# Altium project Powermodule-v7.0.3.PrjPcb (part 1 of 2)
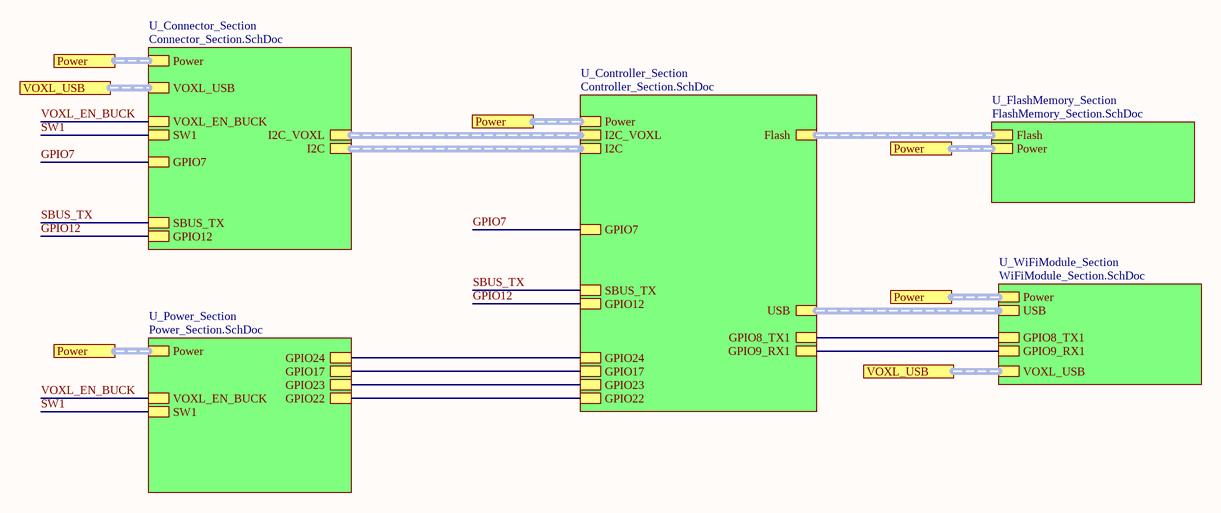
[diagram p0: Top-Sheet.SchDoc]
6 sheets, 138 parts. Net scope: hierarchical (ports join the sheet entries above them; power ports are global).
Board file: PCB-Powermodule-v7.0.3.PcbDoc
Sheets:
  Top-Sheet.SchDoc
    U_Connector_Section = Connector_Section.SchDoc
    U_Controller_Section = Controller_Section.SchDoc
    U_FlashMemory_Section = FlashMemory_Section.SchDoc
    U_Power_Section = Power_Section.SchDoc
    U_WiFiModule_Section = WiFiModule_Section.SchDoc

## Sheet Top-Sheet.SchDoc
size A4; SheetNumber: 1; SheetTotal: 6

### Sub-sheets
U_Connector_Section = Connector_Section.SchDoc: Power (harness Power), I2C_VOXL (harness I2C_VOXL), I2C (harness I2C), VOXL_USB (harness VOXL_USB), SW1, VOXL_EN_BUCK, GPIO7, SBUS_TX, GPIO12
U_Controller_Section = Controller_Section.SchDoc: Flash (harness Flash), Power (harness Power), I2C_VOXL (harness I2C_VOXL), I2C (harness I2C), USB (harness USB), GPIO7, SBUS_TX, GPIO12, GPIO8_TX1, GPIO9_RX1, GPIO24, GPIO17, GPIO23, GPIO22
U_FlashMemory_Section = FlashMemory_Section.SchDoc: Flash (harness Flash), Power (harness Power)
U_Power_Section = Power_Section.SchDoc: Power (harness Power), SW1, VOXL_EN_BUCK, GPIO24, GPIO17, GPIO23, GPIO22
U_WiFiModule_Section = WiFiModule_Section.SchDoc: VOXL_USB (harness VOXL_USB), USB (harness USB), GPIO8_TX1, GPIO9_RX1, Power (harness Power)

### Ports
Power, VOXL_USB

### Nets
VOXL_EN_BUCK: sheet U_Connector_Section/VOXL_EN_BUCK, sheet U_Power_Section/VOXL_EN_BUCK
GPIO7: sheet U_Connector_Section/GPIO7, sheet U_Controller_Section/GPIO7
GPIO8_TX1: sheet U_Controller_Section/GPIO8_TX1, sheet U_WiFiModule_Section/GPIO8_TX1
GPIO9_RX1: sheet U_Controller_Section/GPIO9_RX1, sheet U_WiFiModule_Section/GPIO9_RX1
GPIO12: sheet U_Connector_Section/GPIO12, sheet U_Controller_Section/GPIO12
GPIO17: sheet U_Controller_Section/GPIO17, sheet U_Power_Section/GPIO17
GPIO22: sheet U_Controller_Section/GPIO22, sheet U_Power_Section/GPIO22
GPIO23: sheet U_Controller_Section/GPIO23, sheet U_Power_Section/GPIO23
GPIO24: sheet U_Controller_Section/GPIO24, sheet U_Power_Section/GPIO24
SBUS_TX: sheet U_Connector_Section/SBUS_TX, sheet U_Controller_Section/SBUS_TX
SW1: sheet U_Connector_Section/SW1, sheet U_Power_Section/SW1

### Buses and harness runs
harness port Power = sheet U_Connector_Section/Power
harness port Power = sheet U_Controller_Section/Power
harness port Power = sheet U_FlashMemory_Section/Power
harness port Power = sheet U_Power_Section/Power
harness port Power = sheet U_WiFiModule_Section/Power
harness port VOXL_USB = sheet U_Connector_Section/VOXL_USB
harness port VOXL_USB = sheet U_WiFiModule_Section/VOXL_USB
harness sheet U_Connector_Section/I2C = sheet U_Controller_Section/I2C
harness sheet U_Connector_Section/I2C_VOXL = sheet U_Controller_Section/I2C_VOXL
harness sheet U_Controller_Section/Flash = sheet U_FlashMemory_Section/Flash
harness sheet U_Controller_Section/USB = sheet U_WiFiModule_Section/USB

### Notes on the sheet
- File:
- Title:
- Date:
- Page
- Num:
- Total:
- Drawn By: Huzaifa Ali

## Sheet Connector_Section.SchDoc
size 420 x 297 mm; SheetNumber: 6; SheetTotal: 6
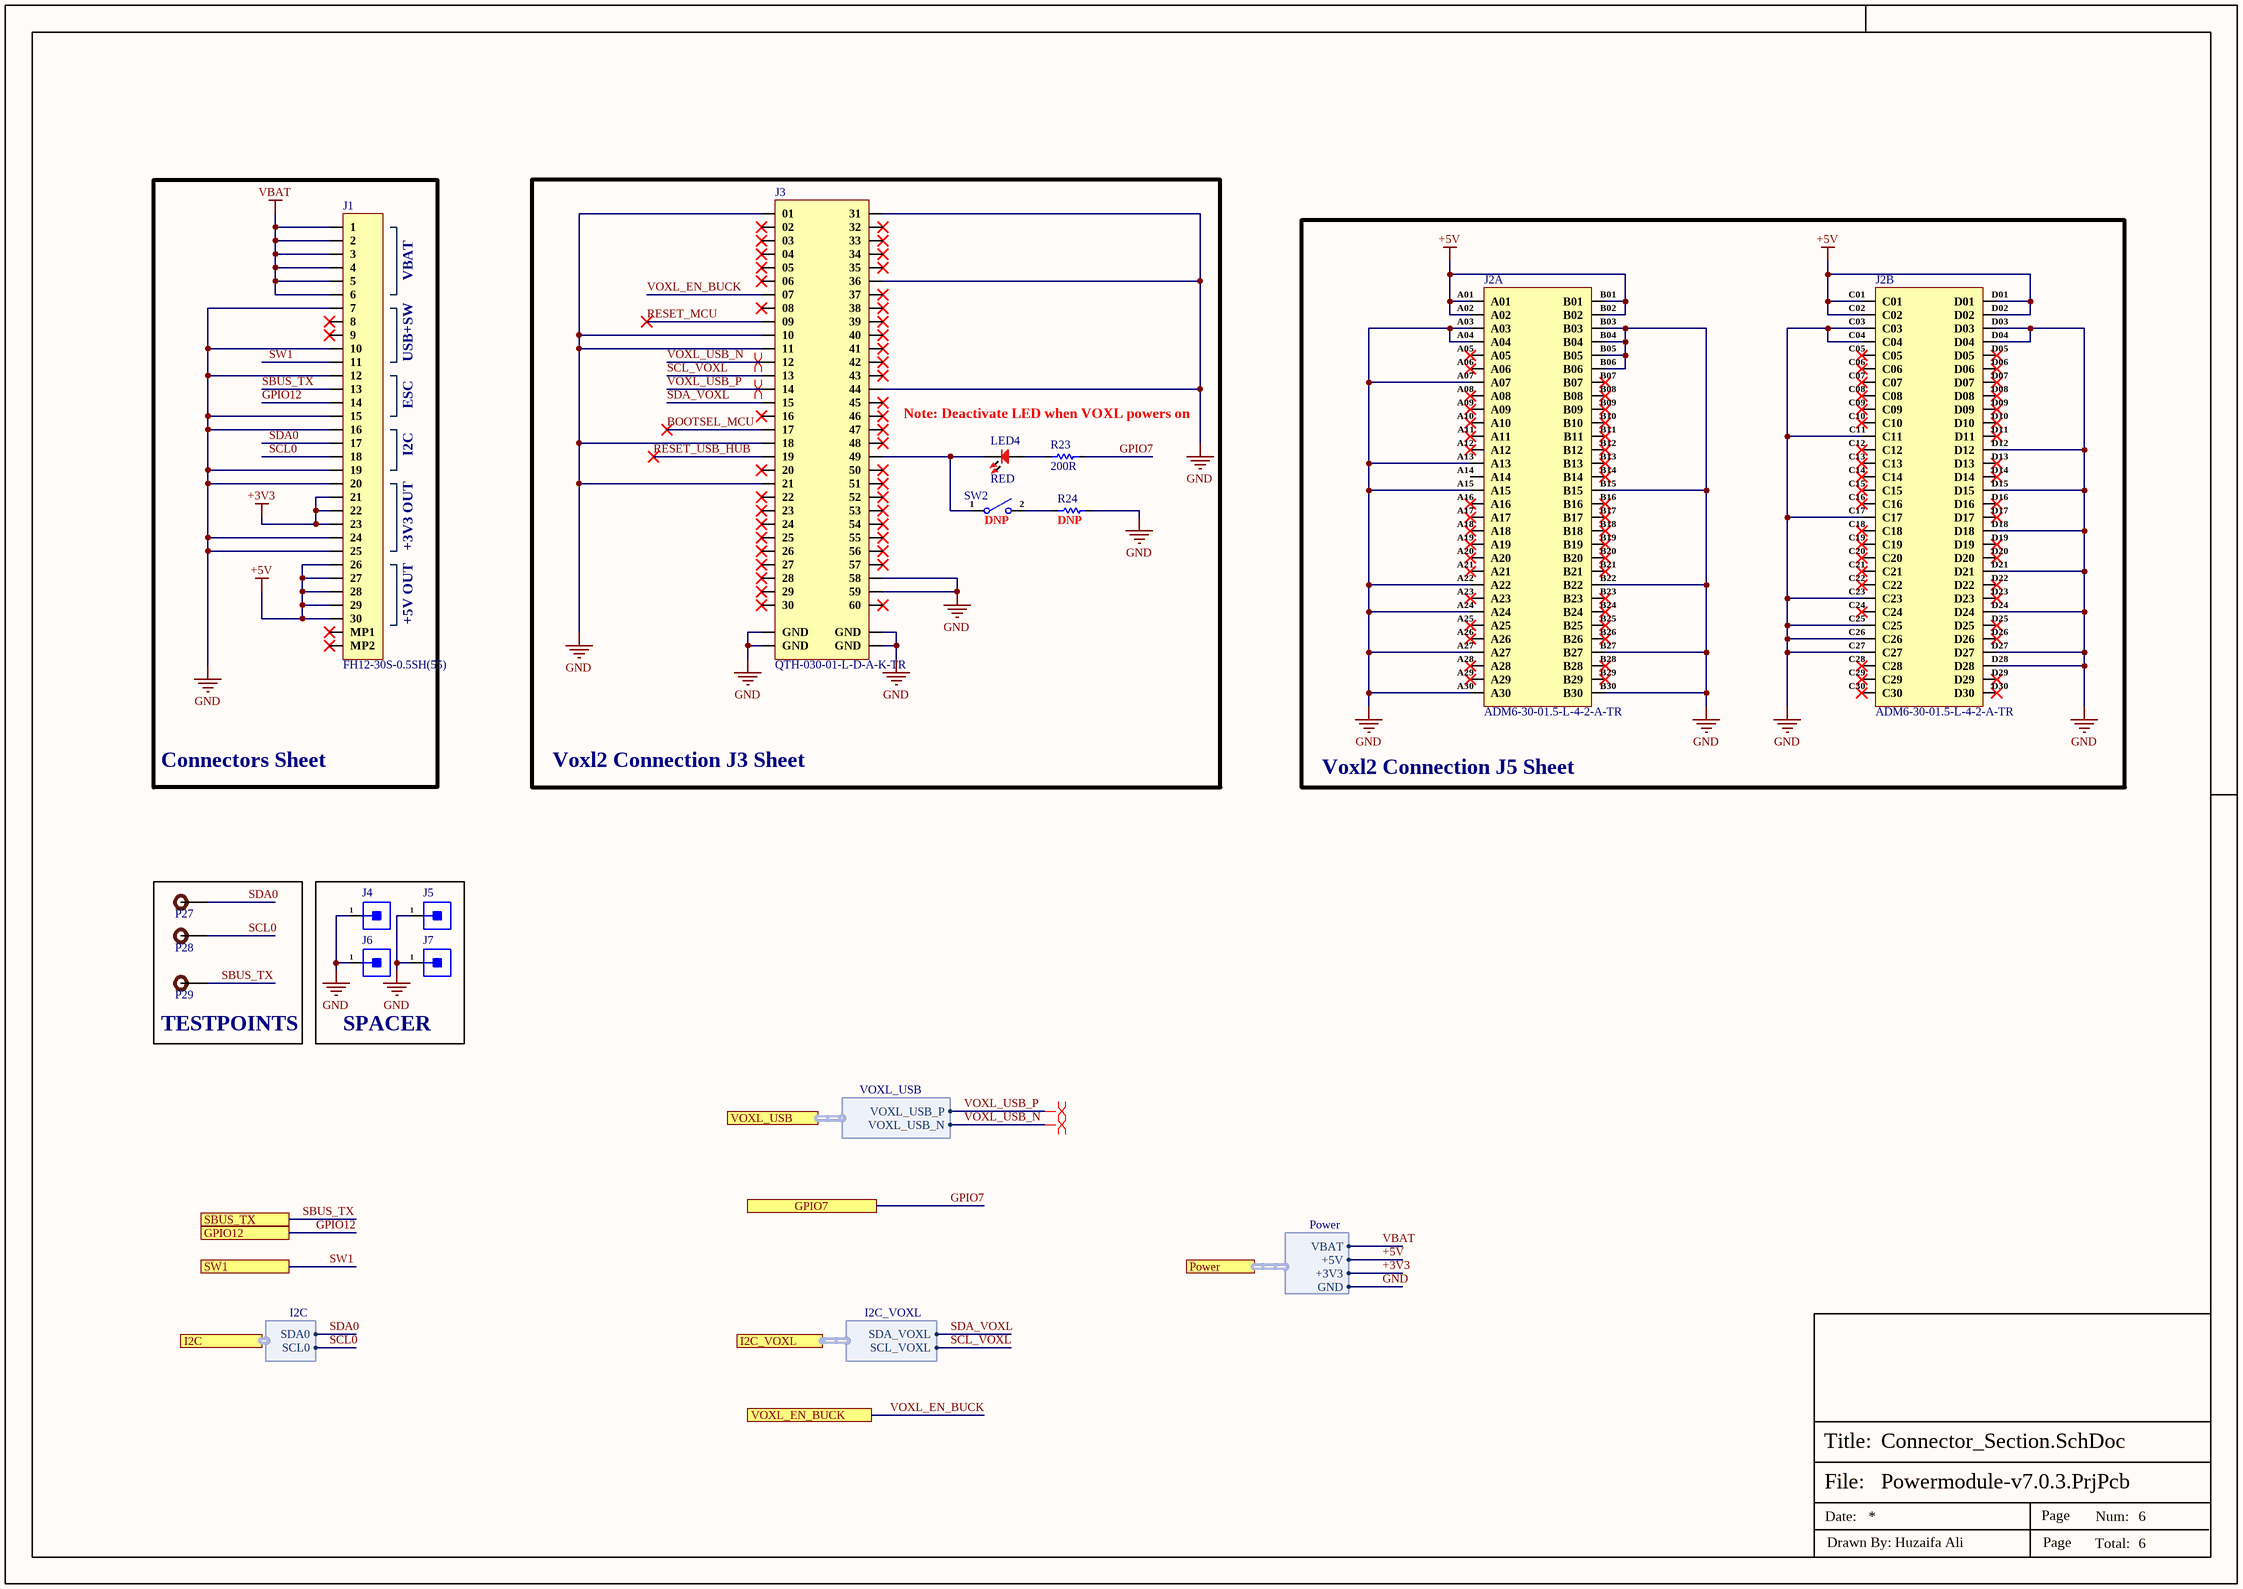
[diagram p1: Connector_Section.SchDoc]

### Parts
J1  FH12-30S-0.5SH(55)  [FH12-30S-0.5SH(55)]
J2  ADM6-30-01.5-L-4-2-A-TR  [ADM6-30-01.5-L-4-2-A-TR]  (parts A,B of 2)
J3  QTH-030-01-L-D-A-K-TR  [QTH-030-01-L-D-A-K-TR]
J4  9774050151R  [Spacer]  (value not drawn)
J5  9774050151R  [Spacer]  (value not drawn)
J6  9774050151R  [Spacer]  (value not drawn)
J7  9774050151R  [Spacer]  (value not drawn)
LED4  RED  [LED-0603]
P27  TEST POINT  [Test-point]  (value not drawn)
P28  TEST POINT  [Test-point]  (value not drawn)
P29  TEST POINT  [Test-point]  (value not drawn)
R23  200R  [Res-0603]
R24  DNP  [Res-0603]
SW2  DNP  [EVQ-P7J01P]

### Blocks framed on the sheet
Connectors Sheet: J1
Voxl2 Connection J3 Sheet: J3 LED4 R23 R24 SW2
Voxl2 Connection J5 Sheet: J2
TESTPOINTS: P27-P29
SPACER: J4-J7

### Ports
GPIO7 (see Top-Sheet[1B], Controller_Section[1D]), GPIO12 (see Top-Sheet[1B], Controller_Section[1D]), I2C (harness I2C, see Top-Sheet[2B], Controller_Section[3D]), I2C_VOXL (harness I2C_VOXL, see Top-Sheet[2B], Controller_Section[2D]), Power (harness Power, see Top-Sheet[1B], Controller_Section[2D], FlashMemory_Section[1D], Power_Section[3D], WiFiModule_Section[2D]), SBUS_TX (see Top-Sheet[1B], Controller_Section[1D]), SW1 (see Top-Sheet[1B], Power_Section[2D]), VOXL_EN_BUCK (see Top-Sheet[1B], Power_Section[2D]), VOXL_USB (harness VOXL_USB, see Top-Sheet[1B], WiFiModule_Section[2D])

### Harnesses
Power: +5V, +3V3, GND, VBAT
I2C_VOXL: SCL_VOXL, SDA_VOXL
I2C: SDA0, SCL0
VOXL_USB: VOXL_USB_P, VOXL_USB_N

### Nets
+3V3: J1.21 J1.22 J1.23 ; port Power.+3V3
+5V: J1.26 J1.27 J1.28 J1.29 J1.30 J2.A01 J2.A02 J2.B01 J2.B02 J2.C01 J2.C02 J2.D01 J2.D02 ; port Power.+5V
GND: J1.7 J1.10 J1.12 J1.15 J1.16 J1.19 J1.20 J1.24 J1.25 J2.A03 J2.A04 J2.A07 J2.A13 J2.A15 J2.A22 J2.A24 J2.A27 J2.A30 J2.B03 J2.B04 J2.B05 J2.B06 J2.B15 J2.B22 J2.B27 J2.B30 J2.C03 J2.C04 J2.C11 J2.C17 J2.C23 J2.C25 J2.C26 J2.C27 J2.D03 J2.D04 J2.D12 J2.D15 J2.D18 J2.D21 J2.D24 J2.D27 J2.D28 J3.01 J3.10 J3.11 J3.18 J3.21 J3.31 J3.36 J3.44 J3.58 J3.59 J3.G1(GND) J3.G2(GND) J3.G3(GND) J3.G4(GND) J4.1 J5.1 J6.1 J7.1 R24.2 ; port Power.GND
VBAT: J1.1 J1.2 J1.3 J1.4 J1.5 J1.6 ; port Power.VBAT
VOXL_EN_BUCK: J3.07 ; port VOXL_EN_BUCK
BOOTSEL_MCU: J3.17
GPIO7: R23.2 ; port GPIO7
GPIO12: J1.14 ; port GPIO12
RESET_MCU: J3.09
RESET_USB_HUB: J3.19
SBUS_TX: J1.13 P29.1 ; port SBUS_TX
SCL0: J1.18 P28.1 ; port I2C.SCL0
SCL_VOXL: J3.13 ; port I2C_VOXL.SCL_VOXL
SDA0: J1.17 P27.1 ; port I2C.SDA0
SDA_VOXL: J3.15 ; port I2C_VOXL.SDA_VOXL
SW1: J1.11 ; port SW1
VOXL_USB_N: J3.12 ; port VOXL_USB.VOXL_USB_N
VOXL_USB_P: J3.14 ; port VOXL_USB.VOXL_USB_P
NetJ3_49: J3.49 LED4.2 SW2.1
NetLED4_1: LED4.1 R23.1
NetR24_1: R24.1 SW2.2

Not connected (* = marked no-connect by the designer): J1 8* 9* MP1* MP2*; J2 A05* A06* A08* A09* A10* A11* A12* A14 A16* A17* A18* A19* A20* A21* A23* A25* A26* A28* A29* B07* B08* B09* B10* B11* B12* B13* B14* B16* B17* B18* B19* B20* B21* B23* B24* B25* B26* B28* B29* C05* C06* C07* C08* C09* C10* C12* C13* C14* C15* C16* C18* C19* C20* C21* C22* C24* C28* C29* C30* D05* D06* D07* D08* D09* D10* D11* D13* D14* D16* D17* D19* D20* D22* D23* D25* D26* D29* D30*; J3 02* 03* 04* 05* 06* 08* 16* 20* 22* 23* 24* 25* 26* 27* 28* 29* 30* 32* 33* 34* 35* 37* 38* 39* 40* 41* 42* 43* 45* 46* 47* 48* 50* 51* 52* 53* 54* 55* 56* 57* 60*

### Layout directives
differential pair; net class VOXL_USB; differential pair class VOXL_USB_Lines; rule Matched Net Lengths [Tolerance = 0.508mm]; rule Impedance Constraint [Min = 88.00    Max = 102.0    ]: VOXL_USB_N, VOXL_USB_P

### Notes on the sheet
- VBAT
- USB+SW
- ESC
- I2C
- Note: Deactivate LED when VOXL powers on
- +3V3 OUT
- +5V OUT
- File:
- Title:
- Date:
- Page
- Num:
- Total:
- Drawn By: Huzaifa Ali

### Library data of the parts
J1 = FH12-30S-0.5SH(55): CONN FFC BOTTOM 30POS 0.5MM R/A; Manufacturer: Hirose; Connector Type: 4640ConnectorType; Contact Voltage Rating (AC): 50V; Contact Pitch: 500um; Item Type: FFC/FPC Connector; Supplier: Future Electronics; Supplier Part Number: 6825061; Manufacturer Part Number: FH12-30S-0.5SH(55); RoHS: Yes; Category: FFC / FPC; Stock: 2000; Pricing: 2000=1.38 (USD); ComponentLink1URL: https://datasheet.ciiva.com/11745/0900766b80d985fc-11745247.pdf?src-supplier=Rs; ComponentLink1Description: https://datasheet.ciiva.com/11745/0900766b80d985fc-11745247.pdf?src-supplier=Rs; ComponentLink2URL: https://datasheet.ciiva.com/15176/getdatasheetpartid-439676-15176854.pdf?src-supplier=Verical; ComponentLink2Description: https://datasheet.ciiva.com/15176/getdatasheetpartid-439676-15176854.pdf?src-supplier=Verical; ComponentLink3URL: https://datasheet.ciiva.com/22630/58803-22630360.pdf?src-supplier=Farnell; ComponentLink3Description: https://datasheet.ciiva.com/22630/58803-22630360.pdf?src-supplier=Farnell; ComponentLink4URL: https://datasheet.ciiva.com/7661/58803-7661387.pdf?src-supplier=Element14; ComponentLink4Description: https://datasheet.ciiva.com/7661/58803-7661387.pdf?src-supplier=Element14; LCSC Part Number: C506793
J2 = ADM6-30-01.5-L-4-2-A-TR: CONN 0.635MM HDR 30POS SMD; Manufacturer: Samtec; Item Type: Connector; Supplier: Rs; Supplier Part Number: 2502799; Manufacturer Part Number: ADM6-30-01.5-L-4-2-A-TR; RoHS: No; Category: Connectors; Stock: 10; Pricing: 1=20.84 (GBP); ComponentLink1URL: http://suddendocs.samtec.com/catalog_english/adm6.pdf?src-supplier=Digi-Key; ComponentLink1Description: http://suddendocs.samtec.com/catalog_english/adm6.pdf?src-supplier=Digi-Key; ComponentLink2URL: https://datasheet.octopart.com/ADM6-30-01.5-L-4-2-A-TR-Samtec-datasheet-156965346.pdf?src-supplier=Sager+Electronics; ComponentLink2Description: https://datasheet.octopart.com/ADM6-30-01.5-L-4-2-A-TR-Samtec-datasheet-156965346.pdf?src-supplier=Sager+Electronics; ComponentLink3URL: https://datasheet.octopart.com/ADM6-30-01.5-L-4-2-A-TR-Samtec-datasheet-154586211.pdf?src-supplier=Toby+Electronics; ComponentLink3Description: https://datasheet.octopart.com/ADM6-30-01.5-L-4-2-A-TR-Samtec-datasheet-154586211.pdf?src-supplier=Toby+Electronics; ComponentLink4URL: https://datasheet.octopart.com/ADM6-30-01.5-L-4-2-A-TR-Samtec-datasheet-142027009.pdf?src-supplier=Master+Electronics; ComponentLink4Description: https://datasheet.octopart.com/ADM6-30-01.5-L-4-2-A-TR-Samtec-datasheet-142027009.pdf?src-supplier=Master+Electronics
J3 = QTH-030-01-L-D-A-K-TR: CONN HDR 60POS SMD GOLD; Manufacturer: Samtec; Supplier: Rs; Supplier Part Number: 1802786; Manufacturer Part Number: QTH-030-01-L-D-A-K-TR; RoHS: Yes; Category: Connectors; Stock: 69; Pricing: 1=9.4, 25=8.99, 100=7.57, 250=6.25, 500=6.09 (GBP); ComponentLink1URL: https://datasheet.ciiva.com/9698/qth-9698170.pdf?src-supplier=Avnet; ComponentLink1Description: https://datasheet.ciiva.com/9698/qth-9698170.pdf?src-supplier=Avnet; ComponentLink2URL: https://datasheet.ciiva.com/400/qth-xxx-xx-x-d-xxx-mkt-400842.pdf?src-supplier=Digikey; ComponentLink2Description: https://datasheet.ciiva.com/400/qth-xxx-xx-x-d-xxx-mkt-400842.pdf?src-supplier=Digikey
J4-J7 = 9774050151R: Spacer Material: Steel Mounting: SMT Series: WA-SMSI Thread D: M2.5; Manufacturer: Wurth Electronics; Plating: Tin; Threaded/Unthreaded: Threaded; Outside Diameter: 0.201inch; Supplier: Digikey; Supplier Part Number: 732-7095-1-ND; Manufacturer Part Number: 9774050151R; RoHS: Yes; Category: Spacers, Standoffs; Stock: 39400; Pricing: 1=1.16, 10=1.098, 50=0.979, 100=0.895 (USD); Material: Steel; Min Operating Temperature: -55°C; Max Operating Temperature: 150°C; Series: WA-SMSI; Packaging: 10Packaging; Length: 0.252inch; Height: 5.1mm; Reach SVHC Compliant: Unknown; ComponentLink1URL: http://www.farnell.com/datasheets/1960373.pdf?src-supplier=Farnell; ComponentLink1Description: http://www.farnell.com/datasheets/1960373.pdf?src-supplier=Farnell; ComponentLink2URL: http://www.mouser.com/ds/2/445/9774050151R-611428.pdf?src-supplier=Mouser; ComponentLink2Description: http://www.mouser.com/ds/2/445/9774050151R-611428.pdf?src-supplier=Mouser; ComponentLink3URL: https://media.digikey.com/pdf/Data%20Sheets/Wurth%20Electronics%20PDFs/WA-SMSx_Performance_Flyer.pdf?src-supplier=Digikey; ComponentLink3Description: https://media.digikey.com/pdf/Data%20Sheets/Wurth%20Electronics%20PDFs/WA-SMSx_Performance_Flyer.pdf?src-supplier=Digikey; ComponentLink4URL: http://www.farnell.com/datasheets/1960373.pdf?src-supplier=Element14; ComponentLink4Description: http://www.farnell.com/datasheets/1960373.pdf?src-supplier=Element14; ComponentLink5URL: https://datasheet.octopart.com/9774050151R-W%C3%BCrth-Elektronik-datasheet-48588545.pdf?src-supplier=Element14; ComponentLink5Description: https://datasheet.octopart.com/9774050151R-W%C3%BCrth-Elektronik-datasheet-48588545.pdf?src-supplier=Element14; ComponentLink6URL: http://www.farnell.com/datasheets/1960373.pdf?src-supplier=Newark; ComponentLink6Description: http://www.farnell.com/datasheets/1960373.pdf?src-supplier=Newark; ComponentLink7URL: https://katalog.we-online.de/em/datasheet/9774050151R.pdf?src-supplier=Digikey; ComponentLink7Description: https://katalog.we-online.de/em/datasheet/9774050151R.pdf?src-supplier=Digikey; Item Type: Spacer
LED4 = NCD0603R3: RED LED 0603 Light Emitting Diodes; Manufacturer: Foshan NationStar Optoelectronics; Manufacturer Part Number: NCD0603R3; Package: 0603; Item Type: LED; LCSC Part Number: C3151730; ComponentLink1Description: LCSC; ComponentLink1URL: https://www.lcsc.com/product-detail/Light-Emitting-Diodes-LED_Foshan-NationStar-Optoelectronics-NCD0603R3_C3151730.html
P27-P29 = TEST POINT: Test Point ON; Item Type: TEST POINT; Manufacturer Part Number: TEST POINT
R23 = RT0603DRD07200RL: RES SMD 200 OHM 0.5% 1/10W 0603; Manufacturer: Yageo; Power Rating: 100mW; Voltage Rating (DC): 50V; Supplier 1: Digi-Key; Manufacturer Part Number: RT0603DRD07200RL; Stock 1: 19572; Pricing 1: 1=0.21, 10=0.174, 100=0.0682, 1000=0.02855, 2500=0.02617 (USD); Case/Package: 0603; Resistance: 200R; Tolerance: 0.5%; Packaging: Cut Tape; Lead Free: Lead Free; Supplier Part Number 1: 311-200DCT-ND; LCSC Part Number: C700498
R24 = RT0603DRD071KL: RES SMD 1K OHM 0.5% 1/10W 0603; Manufacturer: Yageo; Resistance: 1kR; Temperature Coefficient: 25ppm/°C; Power Rating: 100mW; Voltage Rating: 75V; Voltage Rating (DC): 50V; Supplier 1: Digi-Key; Manufacturer Part Number: RT0603DRD071KL; Stock 1: 178947; Pricing 1: 1=0.2, 10=0.167, 100=0.0651, 1000=0.02725, 2500=0.02498 (USD); Case/Package: 0603; Contact Plating: Tin,Matte; Case Code (Metric): 1608; Case Code (Imperial): 0603; Min Operating Temperature: -55°C; Max Operating Temperature: 125°C; Tolerance: 0.5%; Composition: Thin Film; Packaging: Tape and Reel; Termination: SMD/SMT; Radiation Hardening: No; Lead Free: Lead Free; ComponentLink1URL: http://www.mouser.com/ds/2/447/yageodocoutput-1125656.pdf?src-supplier=Mouser; ComponentLink1Description: http://www.mouser.com/ds/2/447/yageodocoutput-1125656.pdf?src-supplier=Mouser; ComponentLink2URL: http://www.yageo.com/documents/recent/PYu-RT_1-to-0.05_RoHS_L_6.pdf?src-supplier=Avnet; ComponentLink2Description: http://www.yageo.com/documents/recent/PYu-RT_1-to-0.05_RoHS_L_6.pdf?src-supplier=Avnet; Supplier Part Number 1: 311-1.0KDDKR-ND; LCSC Part Number: C165964
SW2 = EVQ-P7J01P: SWITCH TACTILE SPST-NO 0.05A 12V; Manufacturer: Panasonic; Mechanical Life: 100000Cycles; Actuator Color: Black; Operating Force: 1.6N; Current Rating: 50mA; Throw Configuration: SPST; Contact Resistance: 500mR; Illumination Type: Non-Illuminated; Switch Travel: 0.2mm; Switch Function: Off-Mom; Actuator Length: 0.65mm; Supplier: Mouser; Supplier Part Number: 667-EVQP7J01P; Manufacturer Part Number: EVQ-P7J01P; RoHS: Yes; Category: Tactile Switches; Stock: 9778; Pricing: 1=0.28, 10=0.252, 50=0.252, 100=0.217, 1000=0.173, 10000=0.148 (USD); Mounting Technology: Surface Mount; Case/Package: SMD/SMT; Min Operating Temperature: -20°C; Max Operating Temperature: 70°C; Package Quantity: 5000; Packaging: Tape and Reel; Voltage Rating (DC): 12V; Max Voltage Rating (DC): 12V; Termination: Gull Wing; Contact Current Rating: 50mA; Electrical Life: 100000Cycles; Orientation: Right Angle; Series: EVQP7; Length: 3.5mm; Width: 2.9mm; Height: 1.35mm; Radiation Hardening: No; Reach SVHC Compliant: No; Lead Free: Lead Free; RoHS Compliant: Yes; ComponentLink1URL: https://datasheet.ciiva.com/24076/atv0000ce4-259034-24076561.pdf?src-supplier=Mouser; ComponentLink1Description: https://datasheet.ciiva.com/24076/atv0000ce4-259034-24076561.pdf?src-supplier=Mouser; ComponentLink2URL: https://datasheet.ciiva.com/22777/atk0000ce20-22777575.pdf?src-supplier=Farnell; ComponentLink2Description: https://datasheet.ciiva.com/22777/atk0000ce20-22777575.pdf?src-supplier=Farnell; ComponentLink3URL: https://datasheet.ciiva.com/29974/atk0000ce20-29974069.pdf?src-supplier=Avnet; ComponentLink3Description: https://datasheet.ciiva.com/29974/atk0000ce20-29974069.pdf?src-supplier=Avnet; ComponentLink4URL: https://datasheet.ciiva.com/30252/atk0000ce20-30252044.pdf?src-supplier=Onlinecomponents.com; ComponentLink4Description: https://datasheet.ciiva.com/30252/atk0000ce20-30252044.pdf?src-supplier=Onlinecomponents.com; Item Type: SWITCH

## Sheet Controller_Section.SchDoc
size A4; SheetNumber: 3; SheetTotal: 6
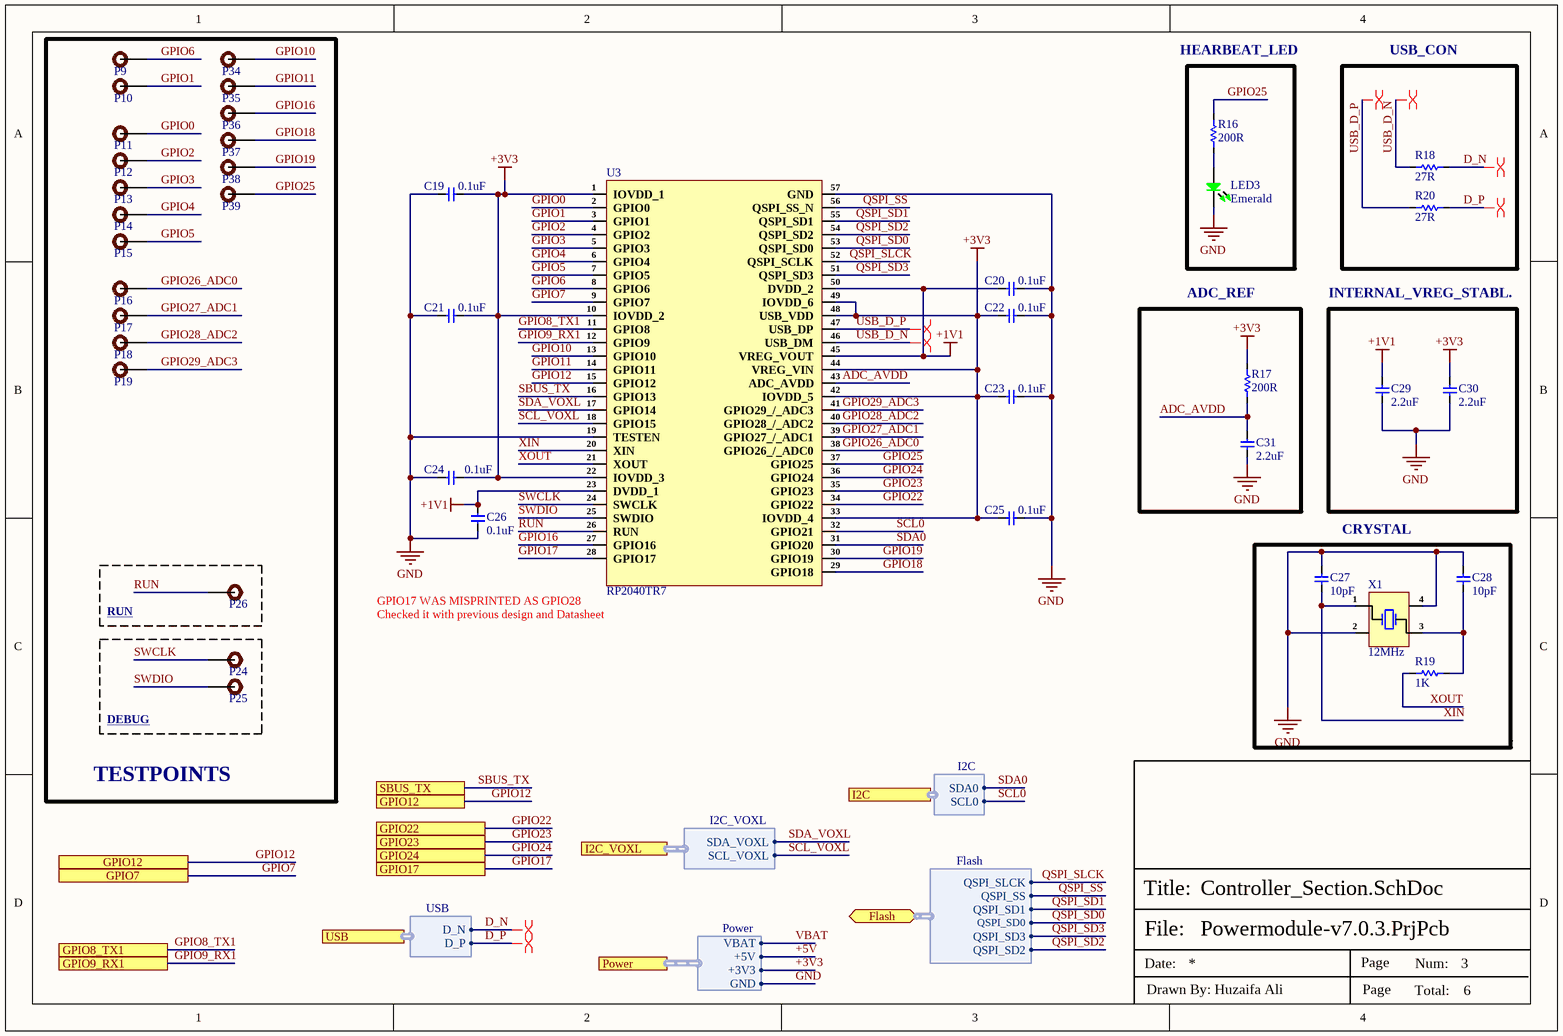
[diagram p2: Controller_Section.SchDoc]

### Parts
C19  0.1uF  [Cap-0603]
C20  0.1uF  [Cap-0603]
C21  0.1uF  [Cap-0603]
C22  0.1uF  [Cap-0603]
C23  0.1uF  [Cap-0603]
C24  0.1uF  [Cap-0603]
C25  0.1uF  [Cap-0603]
C26  0.1uF  [Cap-0603]
C27  10pF  [Cap-0603]
C28  10pF  [Cap-0603]
C29  2.2uF  [CAP-0603]
C30  2.2uF  [CAP-0603]
C31  2.2uF  [CAP-0603]
LED3  Emerald  [LED-0603]
P9  TEST POINT  [Test-point]  (value not drawn)
P10  TEST POINT  [Test-point]  (value not drawn)
P11  TEST POINT  [Test-point]  (value not drawn)
P12  TEST POINT  [Test-point]  (value not drawn)
P13  TEST POINT  [Test-point]  (value not drawn)
P14  TEST POINT  [Test-point]  (value not drawn)
P15  TEST POINT  [Test-point]  (value not drawn)
P16  TEST POINT  [Test-point]  (value not drawn)
P17  TEST POINT  [Test-point]  (value not drawn)
P18  TEST POINT  [Test-point]  (value not drawn)
P19  TEST POINT  [Test-point]  (value not drawn)
P24  TEST POINT  [Test-point]  (value not drawn)
P25  TEST POINT  [Test-point]  (value not drawn)
P26  TEST POINT  [Test-point]  (value not drawn)
P34  TEST POINT  [Test-point]  (value not drawn)
P35  TEST POINT  [Test-point]  (value not drawn)
P36  TEST POINT  [Test-point]  (value not drawn)
P37  TEST POINT  [Test-point]  (value not drawn)
P38  TEST POINT  [Test-point]  (value not drawn)
P39  TEST POINT  [Test-point]  (value not drawn)
R16  200R  [Res-0603]
R17  200R  [Res-0603]
R18  27R  [Res-0603]
R19  1K  [Res-0603]
R20  27R  [Res-0603]
U3  RP2040TR7  [QFN-56 (7x7)]
X1  12MHz  [MCSJK-7U-12.00-10-10-80-B-10]

### Blocks framed on the sheet
TESTPOINTS: P9-P19 P34-P39
USB_CON: R18 R20
ADC_REF: C31 R17
INTERNAL_VREG_STABL.: C29 C30
RUN: P26
DEBUG: P24 P25

### Ports
Flash (bidir, harness Flash, see Top-Sheet[3B], FlashMemory_Section[2D]), GPIO7 (see Top-Sheet[2B], Connector_Section[2D]), GPIO8_TX1 (see Top-Sheet[3C], WiFiModule_Section[2D]), GPIO9_RX1 (see Top-Sheet[3C], WiFiModule_Section[2D]), GPIO12 (see Top-Sheet[2C], Connector_Section[1D]), GPIO17 (see Top-Sheet[2C], Power_Section[2D]), GPIO22 (see Top-Sheet[2C], Power_Section[2D]), GPIO23 (see Top-Sheet[2C], Power_Section[2D]), GPIO24 (see Top-Sheet[2C], Power_Section[2D]), I2C (harness I2C, see Top-Sheet[2B], Connector_Section[1D]), I2C_VOXL (harness I2C_VOXL, see Top-Sheet[2B], Connector_Section[2D]), Power (harness Power, see Top-Sheet[2B], Connector_Section[4D], FlashMemory_Section[1D], Power_Section[3D], WiFiModule_Section[2D]), SBUS_TX (see Top-Sheet[2B], Connector_Section[1D]), USB (harness USB, see Top-Sheet[3C], WiFiModule_Section[2D])

### Harnesses
Flash: QSPI_SLCK, QSPI_SS, QSPI_SD1, QSPI_SD3, QSPI_SD0, QSPI_SD2
Power: +5V, +3V3, GND, VBAT
I2C_VOXL: SCL_VOXL, SDA_VOXL
I2C: SDA0, SCL0
USB: D_N, D_P

### Nets
+1V1: C20.2 C26.2 C29.2 U3.23(DVDD_1) U3.45(VREG_VOUT) U3.50(DVDD_2)
+3V3: C19.1 C21.1 C22.2 C23.2 C24.1 C25.2 C30.2 R17.2 U3.1(IOVDD_1) U3.10(IOVDD_2) U3.22(IOVDD_3) U3.33(IOVDD_4) U3.42(IOVDD_5) U3.44(VREG_VIN) U3.48(USB_VDD) U3.49(IOVDD_6) ; port Power.+3V3
GND: C19.2 C20.1 C21.2 C22.1 C23.1 C24.2 C25.1 C26.1 C27.2 C28.2 C29.1 C30.1 C31.1 LED3.2 U3.19(TESTEN) U3.57(GND) X1.2(GND) X1.4(VDD) ; port Power.GND
ADC_AVDD: C31.2 R17.1 U3.43(ADC_AVDD)
D_N: R18.2 ; port USB.D_N
D_P: R20.2 ; port USB.D_P
GPIO0: P11.1 U3.2(GPIO0)
GPIO1: P10.1 U3.3(GPIO1)
GPIO2: P12.1 U3.4(GPIO2)
GPIO3: P13.1 U3.5(GPIO3)
GPIO4: P14.1 U3.6(GPIO4)
GPIO5: P15.1 U3.7(GPIO5)
GPIO6: P9.1 U3.8(GPIO6)
GPIO7: U3.9(GPIO7) ; port GPIO7
GPIO8_TX1: U3.11(GPIO8) ; port GPIO8_TX1
GPIO9_RX1: U3.12(GPIO9) ; port GPIO9_RX1
GPIO10: P34.1 U3.13(GPIO10)
GPIO11: P35.1 U3.14(GPIO11)
GPIO12: U3.15(GPIO12) ; port GPIO12
GPIO16: P36.1 U3.27(GPIO16)
GPIO17: U3.28(GPIO17) ; port GPIO17
GPIO18: P37.1 U3.29(GPIO18)
GPIO19: P38.1 U3.30(GPIO19)
GPIO22: U3.34(GPIO22) ; port GPIO22
GPIO23: U3.35(GPIO23) ; port GPIO23
GPIO24: U3.36(GPIO24) ; port GPIO24
GPIO25: P39.1 R16.2 U3.37(GPIO25)
GPIO26_ADC0: P16.1 U3.38(GPIO26_/_ADC0)
GPIO27_ADC1: P17.1 U3.39(GPIO27_/_ADC1)
GPIO28_ADC2: P18.1 U3.40(GPIO28_/_ADC2)
GPIO29_ADC3: P19.1 U3.41(GPIO29_/_ADC3)
QSPI_SD0: U3.53(QSPI_SD0) ; port Flash.QSPI_SD0
QSPI_SD1: U3.55(QSPI_SD1) ; port Flash.QSPI_SD1
QSPI_SD2: U3.54(QSPI_SD2) ; port Flash.QSPI_SD2
QSPI_SD3: U3.51(QSPI_SD3) ; port Flash.QSPI_SD3
QSPI_SLCK: U3.52(QSPI_SCLK) ; port Flash.QSPI_SLCK
QSPI_SS: U3.56(QSPI_SS_N) ; port Flash.QSPI_SS
RUN: P26.1 U3.26(RUN)
SBUS_TX: U3.16(GPIO13) ; port SBUS_TX
SCL0: U3.32(GPIO21) ; port I2C.SCL0
SCL_VOXL: U3.18(GPIO15) ; port I2C_VOXL.SCL_VOXL
SDA0: U3.31(GPIO20) ; port I2C.SDA0
SDA_VOXL: U3.17(GPIO14) ; port I2C_VOXL.SDA_VOXL
SWCLK: P24.1 U3.24(SWCLK)
SWDIO: P25.1 U3.25(SWDIO)
USB_D_N: R18.1 U3.46(USB_DM)
USB_D_P: R20.1 U3.47(USB_DP)
XIN: C27.1 U3.20(XIN) X1.1(ENABLE_CONTROL)
XOUT: R19.1 U3.21(XOUT)
NetC28_1: C28.1 R19.2 X1.3(OUT_PUT)
NetLED3_1: LED3.1 R16.1

### Layout directives
differential pair; net class USB_D; differential pair class USB_D_Lines; rule Matched Net Lengths [Tolerance = 0.508mm]; rule Impedance Constraint [Min = 88.00    Max = 102.0    ]: USB_D_N, USB_D_P
differential pair; rule Impedance Constraint [Min = 88.00    Max = 102.0    ]; rule Matched Net Lengths [Tolerance = 0.508mm]; net class D; differential pair class D_Lines: D_N, D_P

### Notes on the sheet
- HEARBEAT_LED
- (near C27) CRYSTAL
- (near U3) GPIO17 WAS MISPRINTED AS GPIO28
  Checked it with previous design and Datasheet
- File:
- Title:
- Date:
- Page
- Num:
- Total:
- Drawn By: Huzaifa Ali

### Library data of the parts
C19-C26 = CL10B104KB8NNNC: CAP CER 0.1UF 50V X7R 0603; Manufacturer: Samsung; Material: Ceramic; Capacitance: 100nF; Tolerance: 10%; Supplier 1: Digi-Key; Manufacturer Part Number: CL10B104KB8NNNC; RoHS: Yes; Category: Ceramic Capacitors; Stock 1: 3998791; Pricing 1: 1=0.10000, 10=0.03000, 50=0.01640, 100=0.01340, 500=0.00954, 1000=0.00750 (USD); Mount: Surface Mount; Case/Package: 0603; Case Code (Metric): 1608; Case Code (Imperial): 0603; Contact Plating: Tin; Min Operating Temperature: -55°C; Max Operating Temperature: 125°C; Dielectric: X7R; Voltage Rating: 50V; Package Quantity: 1; Packaging: Tape and Reel; Voltage: 50V; Voltage Rating (DC): 50V; Series: CL; Construction: Flat; Length: 1.6mm; Width: 0.031inch; Height: 0.8mm; Depth: 0.8mm; Thickness: 0.035inch; Radiation Hardening: No; Lead Free: Lead Free; RoHS Compliant: Yes; ComponentLink1URL: https://datasheet.ciiva.com/25803/cl10b104kb8nnnc-25803393.pdf?src-supplier=Digi-Key; ComponentLink1Description: https://datasheet.ciiva.com/25803/cl10b104kb8nnnc-25803393.pdf?src-supplier=Digi-Key; ComponentLink2URL: https://datasheet.ciiva.com/26838/getdatasheetpartid-89097-26838411.pdf?src-supplier=Verical; ComponentLink2Description: https://datasheet.ciiva.com/26838/getdatasheetpartid-89097-26838411.pdf?src-supplier=Verical; ComponentLink3URL: https://datasheet.ciiva.com/29198/456651-da-01-en-vs-kondensator-0605-29198839.pdf?src-supplier=Conrad; ComponentLink3Description: https://datasheet.ciiva.com/29198/456651-da-01-en-vs-kondensator-0605-29198839.pdf?src-supplier=Conrad; Supplier Part Number 1: 1276-1000-1-ND; LCSC Part Number: C1591
C27 C28 = CC0603JRNPO9BN100: CAP CER 10PF 50V C0G/NPO 0603; Manufacturer: Yageo; Tolerance: 5%; Dielectric: C0G; Temperature Coefficient: 30ppm/°C; Insulation Resistance: 100GR; ComponentLink1URL: https://datasheet.ciiva.com/25787/cl10a475ka8nqnc-25787017.pdf?src-supplier=Digi-Key; ComponentLink1Description: https://datasheet.ciiva.com/25787/cl10a475ka8nqnc-25787017.pdf?src-supplier=Digi-Key; ComponentLink2URL: https://datasheet.ciiva.com/144/mlccorderingcode-144651.pdf?src-supplier=Digi-Key; ComponentLink2Description: https://datasheet.ciiva.com/144/mlccorderingcode-144651.pdf?src-supplier=Digi-Key; ComponentLink3URL: https://datasheet.ciiva.com/11786/0900766b8079c870-11786407.pdf?src-supplier=RSComponents; ComponentLink3Description: https://datasheet.ciiva.com/11786/0900766b8079c870-11786407.pdf?src-supplier=RSComponents; ComponentLink4URL: https://datasheet.ciiva.com/5789/1734582-5789616.pdf?src-supplier=Farnell; ComponentLink4Description: https://datasheet.ciiva.com/5789/1734582-5789616.pdf?src-supplier=Farnell; ComponentLink5URL: https://datasheet.ciiva.com/26862/getdatasheetpartid-403524-26862758.pdf?src-supplier=Verical; ComponentLink5Description: https://datasheet.ciiva.com/26862/getdatasheetpartid-403524-26862758.pdf?src-supplier=Verical; ComponentLink6URL: https://datasheet.ciiva.com/7978/1132289-7978126.pdf?src-supplier=Element14; ComponentLink6Description: https://datasheet.ciiva.com/7978/1132289-7978126.pdf?src-supplier=Element14; ComponentLink7URL: https://datasheet.ciiva.com/46430/1835847-46430150.pdf?src-supplier=Element14; ComponentLink7Description: https://datasheet.ciiva.com/46430/1835847-46430150.pdf?src-supplier=Element14; ComponentLink8URL: https://datasheet.ciiva.com/144/mlccorderingcode-144650.pdf?src-supplier=Digi-Key; ComponentLink8Description: https://datasheet.ciiva.com/144/mlccorderingcode-144650.pdf?src-supplier=Digi-Key; ComponentLink9URL: https://datasheet.ciiva.com/144/mlccorderingcode-144649.pdf?src-supplier=Digi-Key; ComponentLink9Description: https://datasheet.ciiva.com/144/mlccorderingcode-144649.pdf?src-supplier=Digi-Key; ComponentLink10URL: https://datasheet.ciiva.com/5425/upy-gp-np0-16v-to-50v-8-5425564.pdf?src-supplier=Mouser; ComponentLink10Description: https://datasheet.ciiva.com/5425/upy-gp-np0-16v-to-50v-8-5425564.pdf?src-supplier=Mouser; ComponentLink11URL: https://datasheet.ciiva.com/8033/1734582-8033710.pdf?src-supplier=Element14; ComponentLink11Description: https://datasheet.ciiva.com/8033/1734582-8033710.pdf?src-supplier=Element14; ComponentLink12URL: https://datasheet.ciiva.com/8033/1734582-8033706.pdf?src-supplier=Element14; ComponentLink12Description: https://datasheet.ciiva.com/8033/1734582-8033706.pdf?src-supplier=Element14; Supplier 1: Digi-Key; Manufacturer Part Number: CC0603JRNPO9BN100; RoHS: Yes; Category: Ceramic Capacitors; Stock 1: 1700978; Pricing 1: 1=0.10000, 10=0.03900, 50=0.02120, 100=0.01740, 500=0.01240, 1000=0.00974 (USD); Mount: Surface Mount; Case/Package: 0603; Number of Pins: 2; Case Code (Metric): 1608; Case Code (Imperial): 0603; Min Operating Temperature: -55°C; Max Operating Temperature: 125°C; Capacitance: 10pF; Voltage: 50V; Voltage Rating: 50V; Voltage Rating (DC): 50V; Packaging: Tape and Reel; Package Quantity: 1; Termination: SMD/SMT; Resistor Type: Ceramic; Series: CC; Length: 1.6mm; Width: 0.031inch; Height: 0.8mm; Thickness: 0.035inch; Depth: 0.8mm; Radiation Hardening: No; RoHS Compliant: Yes; REACH SVHC: No SVHC; Lead Free: Lead Free; Supplier Part Number 1: 311-1058-1-ND; LCSC Part Number: C106245
C29-C31 = CC0603KRX5R8BB225: CAP CER 2.2UF 25V X5R 0603; Manufacturer: Yageo; Tolerance: 10%; Item Type: Capacitor; Supplier 1: Digi-Key; Manufacturer Part Number: CC0603KRX5R8BB225; Stock 1: 687936; Pricing 1: 1=0.4, 10=0.276, 50=0.1932, 100=0.1656, 500=0.1242, 1000=0.10488 (USD); Mount: Surface Mount; Case/Package: 0603; Case Code (Metric): 1608; Case Code (Imperial): 0603; Weight: 7.1E-05oz; Min Operating Temperature: -55°C; Max Operating Temperature: 85°C; Packaging: Tape and Reel; Capacitance: 2.2uF; Dielectric: X5R; Voltage Rating: 25V; Termination: SMD/SMT; Resistor Type: Ceramic; Voltage Rating (DC): 25V; Package Quantity: 4000; Length: 1.6mm; Width: 0.031inch; Thickness: 0.037inch; Depth: 0.8mm; Radiation Hardening: No; Lead Free: Lead Free; Halogen Free: Halogen Free; RoHS Compliant: Yes; ComponentLink1URL: https://www.verical.com/server-webapp/html/getDatasheet?partID=782757&src-supplier=Verical; ComponentLink1Description: https://www.verical.com/server-webapp/html/getDatasheet?partID=782757&src-supplier=Verical; Supplier Part Number 1: 311-1786-1-ND; LCSC Part Number: C309478
LED3 = NCD0603G2: Emerald 0603 Light Emitting Diodes (LED) ROHS; Manufacturer: Foshan NationStar Optoelectronics; Manufacturer Part Number: NCD0603G2; Package: 0603; LCSC Part Number: C87326; Item Type: LED; ComponentLink1Description: LCSC; ComponentLink1URL: https://www.lcsc.com/product-detail/Light-Emitting-Diodes-LED_Foshan-NationStar-Optoelectronics-NCD0603G2_C87326.html
P9-P19 P24-P26 P34-P39 = TEST POINT: Test Point ON; Item Type: TEST POINT; Manufacturer Part Number: TEST POINT
R16 R17 = RT0603DRD07200RL: as R23 on sheet Connector_Section; Supplier 1: Digi-Key; Manufacturer Part Number: RT0603DRD07200RL; Stock 1: 19572; Pricing 1: 1=0.21, 10=0.174, 100=0.0682, 1000=0.02855, 2500=0.02617 (USD); Case/Package: 0603; Resistance: 200R; Tolerance: 0.5%; Packaging: Cut Tape; Lead Free: Lead Free; Supplier Part Number 1: 311-200DCT-ND; LCSC Part Number: C700498
R18 R20 = RC0603FR-0727RL: RES 27 OHM 1% 1/10W 0603; Manufacturer: Yageo; Voltage Rating (DC): 50V; Temperature Coefficient: 100ppm/°C; Power Rating: 100mW; Item Type: Resistor; Supplier 1: Future Electronics; Manufacturer Part Number: RC0603FR-0727RL; RoHS: Yes; Category: Chip SMD Resistors; Stock 1: 285000; Pricing 1: 5000=0.0015, 50000=0.0014, 200000=0.0014, 625000=0.0013, 2000000=0.0012 (USD); Case/Package: 0603; Pins: 2; Case Code (Metric): 1608; Case Code (Imperial): 0603; Min Operating Temperature: -55°C; Max Operating Temperature: 155°C; Value: 27R; Tolerance: 1%; Packaging: Tape and Reel; Resistor Type: Thick Film; Number of Terminations: 2; Voltage Rating: 50V; Termination: SMD/SMT; Max Power Dissipation: 100mW; Features: Moisture Resistant; Series: RC; Resistance Tolerance: 1%; Width: 0.8mm; Lead Free: Lead Free; Reach SVHC Compliant: Unknown; RoHS Compliant: Yes; ComponentLink1URL: https://datasheet.ciiva.com/2454/pyu-r-int-thick-7-2454031.pdf?src-supplier=Digi-Key; ComponentLink1Description: https://datasheet.ciiva.com/2454/pyu-r-int-thick-7-2454031.pdf?src-supplier=Digi-Key; ComponentLink2URL: https://datasheet.ciiva.com/2454/pyu-r-int-thick-7-2454032.pdf?src-supplier=Digi-Key; ComponentLink2Description: https://datasheet.ciiva.com/2454/pyu-r-int-thick-7-2454032.pdf?src-supplier=Digi-Key; ComponentLink3URL: https://datasheet.ciiva.com/2454/pyu-r-int-thick-7-2454030.pdf?src-supplier=Digi-Key; ComponentLink3Description: https://datasheet.ciiva.com/2454/pyu-r-int-thick-7-2454030.pdf?src-supplier=Digi-Key; ComponentLink4URL: https://datasheet.ciiva.com/7746/443971-7746313.pdf?src-supplier=Element14; ComponentLink4Description: https://datasheet.ciiva.com/7746/443971-7746313.pdf?src-supplier=Element14; ComponentLink5URL: https://datasheet.ciiva.com/7746/443971-7746314.pdf?src-supplier=Element14; ComponentLink5Description: https://datasheet.ciiva.com/7746/443971-7746314.pdf?src-supplier=Element14; Supplier Part Number 1: 9798455; LCSC Part Number: C137753
R19 = RT0603DRD071KL: as R24 on sheet Connector_Section; Supplier 1: Digi-Key; Manufacturer Part Number: RT0603DRD071KL; Stock 1: 178947; Pricing 1: 1=0.2, 10=0.167, 100=0.0651, 1000=0.02725, 2500=0.02498 (USD); Case/Package: 0603; Contact Plating: Tin,Matte; Case Code (Metric): 1608; Case Code (Imperial): 0603; Min Operating Temperature: -55°C; Max Operating Temperature: 125°C; Tolerance: 0.5%; Composition: Thin Film; Packaging: Tape and Reel; Termination: SMD/SMT; Radiation Hardening: No; Lead Free: Lead Free; ComponentLink1URL: http://www.mouser.com/ds/2/447/yageodocoutput-1125656.pdf?src-supplier=Mouser; ComponentLink1Description: http://www.mouser.com/ds/2/447/yageodocoutput-1125656.pdf?src-supplier=Mouser; ComponentLink2URL: http://www.yageo.com/documents/recent/PYu-RT_1-to-0.05_RoHS_L_6.pdf?src-supplier=Avnet; ComponentLink2Description: http://www.yageo.com/documents/recent/PYu-RT_1-to-0.05_RoHS_L_6.pdf?src-supplier=Avnet; Supplier Part Number 1: 311-1.0KDDKR-ND; LCSC Part Number: C165964
U3 = RP2040TR7: Rectifier Diode, 1 Phase, 1 Element, 2A, 400V V(RRM), Silicon, DO-15; Manufacturer: Raspberry Pi; Supplier: Farnell; Supplier Part Number: 3766079; Manufacturer Part Number: RP2040TR7; RoHS: No; Category: Uncategorized; Stock: 11495; Pricing: 500=0.645 (GBP)
X1 = MCSJK-7U-12.00-10-10-80-B-10: Crystal, 12Mhz, 10Pf, 3.2Mm X 2.5Mm Frequency Nom 12Mhz Crystal Case Smd Rohs; Manufacturer: Multicomp; Supplier: Newark; Supplier Part Number: 56AC8904; Manufacturer Part Number: MCSJK-7U-12.00-10-10-80-B-10; RoHS: Yes; Stock: 26807; Pricing: 1=0.428, 10=0.381, 100=0.3, 500=0.246, 1000=0.214, 5000=0.191, 10000=0.172, 25000=0.166 (USD); ComponentLink1URL: http://www.farnell.com/datasheets/2645227.pdf?src-supplier=Farnell; ComponentLink1Description: http://www.farnell.com/datasheets/2645227.pdf?src-supplier=Farnell; Item Type: Crystal

## Sheet FlashMemory_Section.SchDoc
size A4; SheetNumber: 4; SheetTotal: 6
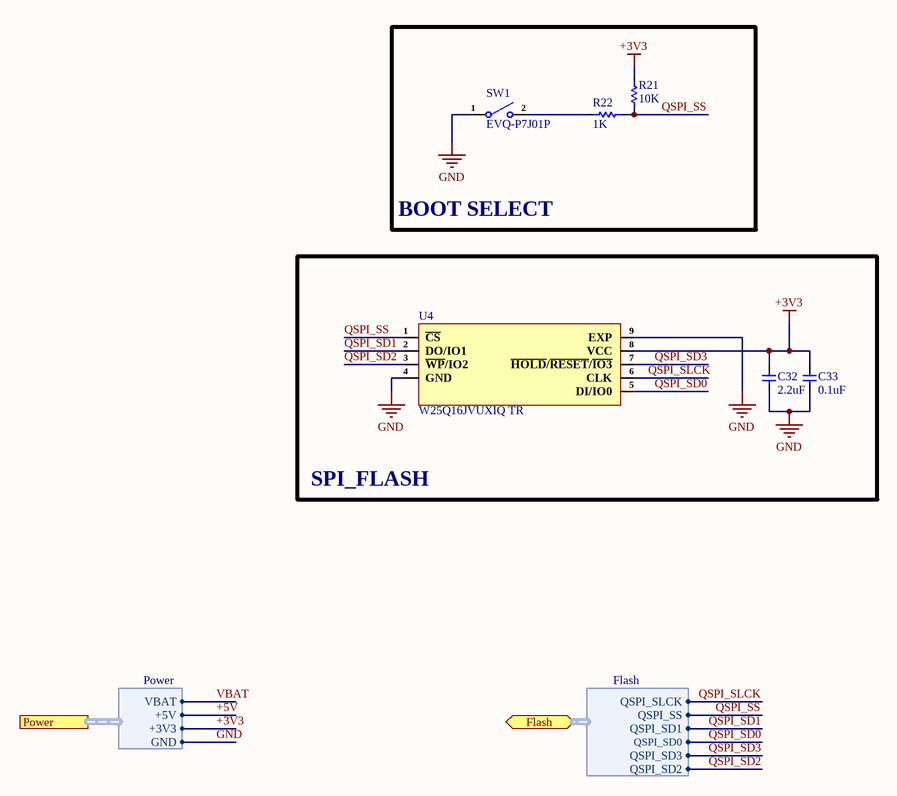
[diagram p3: FlashMemory_Section.SchDoc]

### Parts
C32  2.2uF  [CAP-0603]
C33  0.1uF  [Cap-0603]
R21  10K  [Res-0603]
R22  1K  [Res-0603]
SW1  EVQ-P7J01P  [EVQ-P7J01P]
U4  W25Q16JVUXIQ TR  [8-USON (2x3)]

### Blocks framed on the sheet
BOOT SELECT: R21 R22 SW1
SPI_FLASH: C32 C33 U4

### Ports
Flash (bidir, harness Flash, see Top-Sheet[3B], Controller_Section[3D]), Power (harness Power, see Top-Sheet[3B], Connector_Section[4D], Controller_Section[2D], Power_Section[3D], WiFiModule_Section[2D])

### Harnesses
Flash: QSPI_SLCK, QSPI_SS, QSPI_SD1, QSPI_SD3, QSPI_SD0, QSPI_SD2
Power: +5V, +3V3, GND, VBAT

### Nets
+3V3: C32.2 C33.2 R21.2 U4.8(VCC) ; port Power.+3V3
GND: C32.1 C33.1 SW1.1 U4.4(GND) U4.9(EXP) ; port Power.GND
QSPI_SD0: U4.5(DI/IO0) ; port Flash.QSPI_SD0
QSPI_SD1: U4.2(DO/IO1) ; port Flash.QSPI_SD1
QSPI_SD2: U4.3(~{WP}/IO2) ; port Flash.QSPI_SD2
QSPI_SD3: U4.7(~{HOLD}/~{RESET}/~{IO3}) ; port Flash.QSPI_SD3
QSPI_SLCK: U4.6(CLK) ; port Flash.QSPI_SLCK
QSPI_SS: R21.1 R22.2 U4.1(~{CS}) ; port Flash.QSPI_SS
NetR22_1: R22.1 SW1.2

### Notes on the sheet
- File:
- Title:
- Date:
- Page
- Num:
- Total:
- Drawn By: Huzaifa Ali

### Library data of the parts
C32 = CC0603KRX5R8BB225: as C29 on sheet Controller_Section; Supplier 1: Digi-Key; Manufacturer Part Number: CC0603KRX5R8BB225; Stock 1: 687936; Pricing 1: 1=0.4, 10=0.276, 50=0.1932, 100=0.1656, 500=0.1242, 1000=0.10488 (USD); Mount: Surface Mount; Case/Package: 0603; Case Code (Metric): 1608; Case Code (Imperial): 0603; Weight: 7.1E-05oz; Min Operating Temperature: -55°C; Max Operating Temperature: 85°C; Packaging: Tape and Reel; Capacitance: 2.2uF; Dielectric: X5R; Voltage Rating: 25V; Termination: SMD/SMT; Resistor Type: Ceramic; Voltage Rating (DC): 25V; Package Quantity: 4000; Length: 1.6mm; Width: 0.031inch; Thickness: 0.037inch; Depth: 0.8mm; Radiation Hardening: No; Lead Free: Lead Free; Halogen Free: Halogen Free; RoHS Compliant: Yes; ComponentLink1URL: https://www.verical.com/server-webapp/html/getDatasheet?partID=782757&src-supplier=Verical; ComponentLink1Description: https://www.verical.com/server-webapp/html/getDatasheet?partID=782757&src-supplier=Verical; Supplier Part Number 1: 311-1786-1-ND; LCSC Part Number: C309478
C33 = CL10B104KB8NNNC: as C19 on sheet Controller_Section; Supplier 1: Digi-Key; Manufacturer Part Number: CL10B104KB8NNNC; RoHS: Yes; Category: Ceramic Capacitors; Stock 1: 3998791; Pricing 1: 1=0.10000, 10=0.03000, 50=0.01640, 100=0.01340, 500=0.00954, 1000=0.00750 (USD); Mount: Surface Mount; Case/Package: 0603; Case Code (Metric): 1608; Case Code (Imperial): 0603; Contact Plating: Tin; Min Operating Temperature: -55°C; Max Operating Temperature: 125°C; Dielectric: X7R; Voltage Rating: 50V; Package Quantity: 1; Packaging: Tape and Reel; Voltage: 50V; Voltage Rating (DC): 50V; Series: CL; Construction: Flat; Length: 1.6mm; Width: 0.031inch; Height: 0.8mm; Depth: 0.8mm; Thickness: 0.035inch; Radiation Hardening: No; Lead Free: Lead Free; RoHS Compliant: Yes; ComponentLink1URL: https://datasheet.ciiva.com/25803/cl10b104kb8nnnc-25803393.pdf?src-supplier=Digi-Key; ComponentLink1Description: https://datasheet.ciiva.com/25803/cl10b104kb8nnnc-25803393.pdf?src-supplier=Digi-Key; ComponentLink2URL: https://datasheet.ciiva.com/26838/getdatasheetpartid-89097-26838411.pdf?src-supplier=Verical; ComponentLink2Description: https://datasheet.ciiva.com/26838/getdatasheetpartid-89097-26838411.pdf?src-supplier=Verical; ComponentLink3URL: https://datasheet.ciiva.com/29198/456651-da-01-en-vs-kondensator-0605-29198839.pdf?src-supplier=Conrad; ComponentLink3Description: https://datasheet.ciiva.com/29198/456651-da-01-en-vs-kondensator-0605-29198839.pdf?src-supplier=Conrad; Supplier Part Number 1: 1276-1000-1-ND; LCSC Part Number: C1591
R21 = RT0603BRD0710KL: RES SMD 10K OHM 0.1% 1/10W 0603; Manufacturer: Yageo; Power: 100mW; Rated Temperature: 70°C; Value: 10kR; Temperature Coefficient: 25ppm/°C; Working Voltage: 75V; Package Height: 0.45mm; Package Length: 1.6mm; Package Width: 0.8mm; Item Type: Resistor; Supplier 1: Rs; Manufacturer Part Number: RT0603BRD0710KL; RoHS: Yes; Category: Chip SMD Resistors; Stock 1: 20510; Pricing 1: 100=0.29800, 250=0.27800, 500=0.25900, 1000=0.23700 (GBP); Mounting Technology: Surface Mount; Pins: 2; Case/Package: 0603; Min Operating Temperature: -55°C; Max Operating Temperature: 155°C; Tolerance: 0.1%; Resistor Type: FIXED RESISTOR; Construction: Chip; Package Style: SMTMeter; Packaging: Tape and Reel; Technology: THIN FILM; Termination: Wraparound; Reach SVHC Compliant: Yes; RoHS Compliant: Yes; ComponentLink1URL: https://datasheet.ciiva.com:443/pdfs/VipMasterIC/IC/YAGO/YAGO-S-A0008510989/YAGO-S-A0008510989-1.pdf?src-supplier=IHS+Markit; ComponentLink1Description: https://datasheet.ciiva.com:443/pdfs/VipMasterIC/IC/YAGO/YAGO-S-A0008510989/YAGO-S-A0008510989-1.pdf?src-supplier=IHS+Markit; ComponentLink2URL: https://datasheet.ciiva.com/5624/pyu-rt-1-to-0-05-rohs-l-4-5624351.pdf?src-supplier=Mouser; ComponentLink2Description: https://datasheet.ciiva.com/5624/pyu-rt-1-to-0-05-rohs-l-4-5624351.pdf?src-supplier=Mouser; ComponentLink3URL: https://datasheet.ciiva.com/29721/pyu-rt-1-to-0-05-rohs-l-4-29721177.pdf?src-supplier=Digi-Key; ComponentLink3Description: https://datasheet.ciiva.com/29721/pyu-rt-1-to-0-05-rohs-l-4-29721177.pdf?src-supplier=Digi-Key; Supplier Part Number 1: 1991391P; LCSC Part Number: C95204
R22 = RT0603DRD071KL: as R24 on sheet Connector_Section; Supplier 1: Digi-Key; Manufacturer Part Number: RT0603DRD071KL; Stock 1: 178947; Pricing 1: 1=0.2, 10=0.167, 100=0.0651, 1000=0.02725, 2500=0.02498 (USD); Case/Package: 0603; Contact Plating: Tin,Matte; Case Code (Metric): 1608; Case Code (Imperial): 0603; Min Operating Temperature: -55°C; Max Operating Temperature: 125°C; Tolerance: 0.5%; Composition: Thin Film; Packaging: Tape and Reel; Termination: SMD/SMT; Radiation Hardening: No; Lead Free: Lead Free; ComponentLink1URL: http://www.mouser.com/ds/2/447/yageodocoutput-1125656.pdf?src-supplier=Mouser; ComponentLink1Description: http://www.mouser.com/ds/2/447/yageodocoutput-1125656.pdf?src-supplier=Mouser; ComponentLink2URL: http://www.yageo.com/documents/recent/PYu-RT_1-to-0.05_RoHS_L_6.pdf?src-supplier=Avnet; ComponentLink2Description: http://www.yageo.com/documents/recent/PYu-RT_1-to-0.05_RoHS_L_6.pdf?src-supplier=Avnet; Supplier Part Number 1: 311-1.0KDDKR-ND; LCSC Part Number: C165964
SW1 = EVQ-P7J01P: as SW2 on sheet Connector_Section; Supplier: Mouser; Supplier Part Number: 667-EVQP7J01P; Manufacturer Part Number: EVQ-P7J01P; RoHS: Yes; Category: Tactile Switches; Stock: 9778; Pricing: 1=0.28, 10=0.252, 50=0.252, 100=0.217, 1000=0.173, 10000=0.148 (USD); Mounting Technology: Surface Mount; Case/Package: SMD/SMT; Min Operating Temperature: -20°C; Max Operating Temperature: 70°C; Package Quantity: 5000; Packaging: Tape and Reel; Voltage Rating (DC): 12V; Max Voltage Rating (DC): 12V; Termination: Gull Wing; Contact Current Rating: 50mA; Electrical Life: 100000Cycles; Orientation: Right Angle; Series: EVQP7; Length: 3.5mm; Width: 2.9mm; Height: 1.35mm; Radiation Hardening: No; Reach SVHC Compliant: No; Lead Free: Lead Free; RoHS Compliant: Yes; ComponentLink1URL: https://datasheet.ciiva.com/24076/atv0000ce4-259034-24076561.pdf?src-supplier=Mouser; ComponentLink1Description: https://datasheet.ciiva.com/24076/atv0000ce4-259034-24076561.pdf?src-supplier=Mouser; ComponentLink2URL: https://datasheet.ciiva.com/22777/atk0000ce20-22777575.pdf?src-supplier=Farnell; ComponentLink2Description: https://datasheet.ciiva.com/22777/atk0000ce20-22777575.pdf?src-supplier=Farnell; ComponentLink3URL: https://datasheet.ciiva.com/29974/atk0000ce20-29974069.pdf?src-supplier=Avnet; ComponentLink3Description: https://datasheet.ciiva.com/29974/atk0000ce20-29974069.pdf?src-supplier=Avnet; ComponentLink4URL: https://datasheet.ciiva.com/30252/atk0000ce20-30252044.pdf?src-supplier=Onlinecomponents.com; ComponentLink4Description: https://datasheet.ciiva.com/30252/atk0000ce20-30252044.pdf?src-supplier=Onlinecomponents.com; Item Type: SWITCH
U4 = W25Q16JVUXIQ TR: IC FLASH 16MBIT SPI/QUAD 8USON; Manufacturer: Winbond; Supplier: Digi-Key; Supplier Part Number: 256-W25Q16JVUXIQTRCT-ND; Manufacturer Part Number: W25Q16JVUXIQ TR; RoHS: No; Category: Memory; Stock: 47295; Pricing: 1=0.56, 10=0.51, 25=0.504, 50=0.501, 100=0.4479, 250=0.44416, 500=0.43758, 1000=0.42193 (USD)